# EAGLE schematic FRIDAY_Bridge_SCH3 (EAGLE 9.6.2)
Assembly variants: default

## Sheet 1 of 4
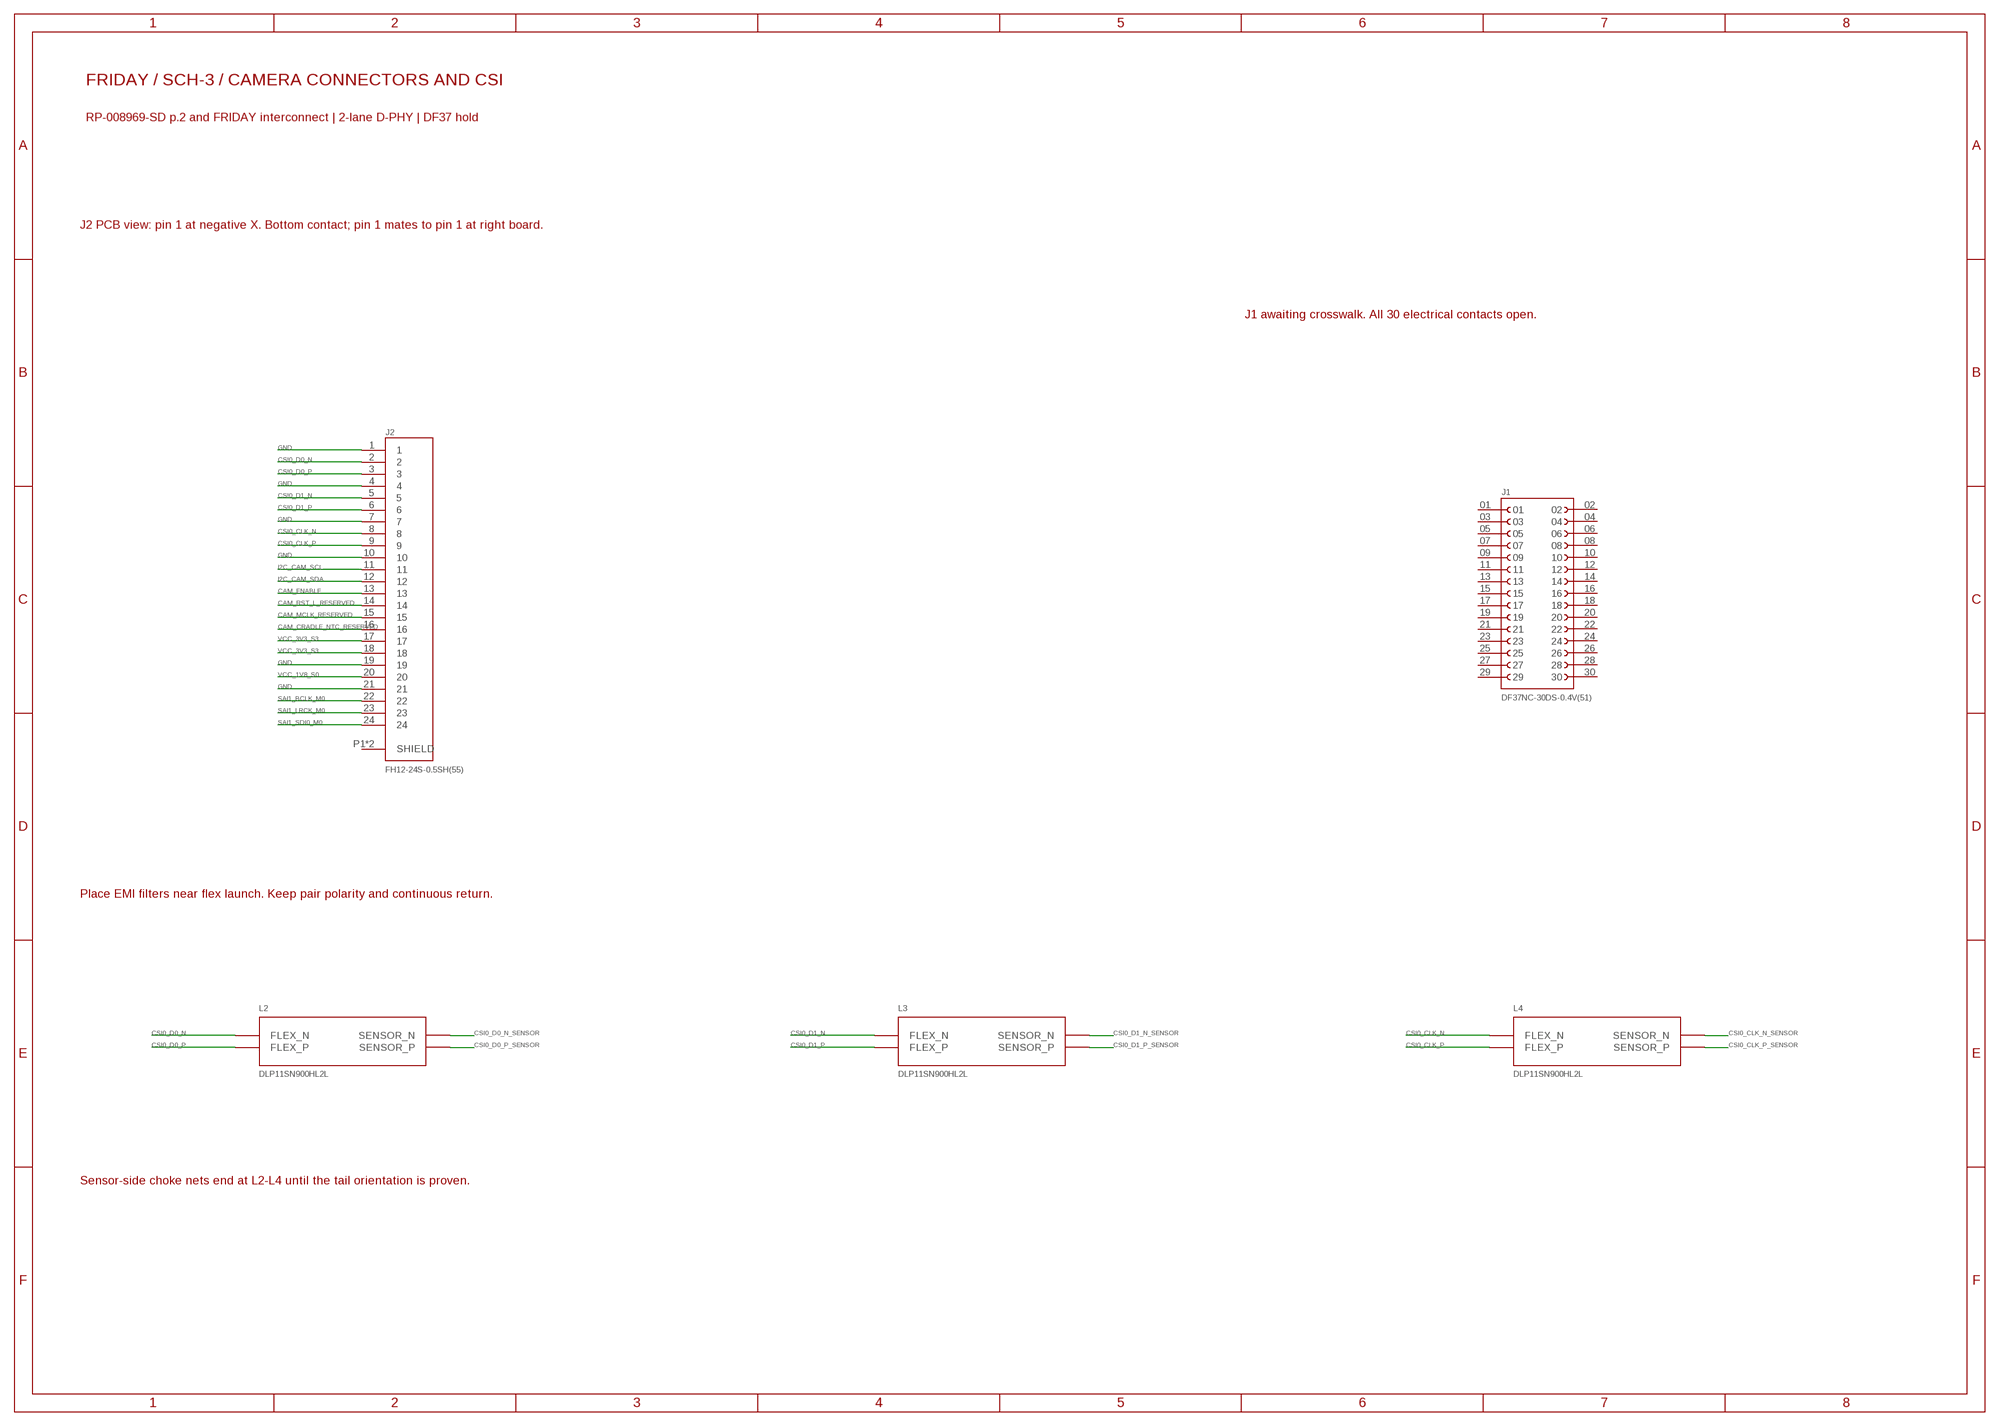
[diagram p0: schematic, sheet 1]

### Parts
J1  DF37NC-30DS-0.4V(51)  [HRS_DF37NC-30DS-0.4V(51)]
J2  FH12-24S-0.5SH(55)  [HRS_FH12-24S-0.5SH(55)]
L2  DLP11SN900HL2L  [DLP11SN_0504]
L3  DLP11SN900HL2L  [DLP11SN_0504]
L4  DLP11SN900HL2L  [DLP11SN_0504]

### Nets
CAM_CRADLE_NTC_RESERVED: J2.16 ; also sheet 3
CAM_ENABLE: J2.13 ; also sheet 2,3
CAM_MCLK_RESERVED: J2.15 ; also sheet 3
CAM_RST_L_RESERVED: J2.14 ; also sheet 3
CSI0_CLK_N: J2.8 L4.1(FLEX_N)
CSI0_CLK_N_SENSOR: L4.2(SENSOR_N)
CSI0_CLK_P: J2.9 L4.4(FLEX_P)
CSI0_CLK_P_SENSOR: L4.3(SENSOR_P)
CSI0_D0_N: J2.2 L2.1(FLEX_N)
CSI0_D0_N_SENSOR: L2.2(SENSOR_N)
CSI0_D0_P: J2.3 L2.4(FLEX_P)
CSI0_D0_P_SENSOR: L2.3(SENSOR_P)
CSI0_D1_N: J2.5 L3.1(FLEX_N)
CSI0_D1_N_SENSOR: L3.2(SENSOR_N)
CSI0_D1_P: J2.6 L3.4(FLEX_P)
CSI0_D1_P_SENSOR: L3.3(SENSOR_P)
GND: J2.1 J2.4 J2.7 J2.10 J2.19 J2.21 ; also sheet 2,3,4
I2C_CAM_SCL: J2.11 ; also sheet 3
I2C_CAM_SDA: J2.12 ; also sheet 3
SAI1_BCLK_M0: J2.22 ; also sheet 4
SAI1_LRCK_M0: J2.23 ; also sheet 4
SAI1_SDI0_M0: J2.24 ; also sheet 4
VCC_1V8_S0: J2.20 ; also sheet 4
VCC_3V3_S3: J2.17 J2.18 ; also sheet 2,3
Unconnected: J1.01 J1.02 J1.03 J1.04 J1.05 J1.06 J1.07 J1.08 J1.09 J1.10 J1.11 J1.12 J1.13 J1.14 J1.15 J1.16 J1.17 J1.18 J1.19 J1.20 J1.21 J1.22 J1.23 J1.24 J1.25 J1.26 J1.27 J1.28 J1.29 J1.30 J2.P1(SHIELD) J2.P2(SHIELD)

### Notes on the sheet
- FRIDAY / SCH-3 / CAMERA CONNECTORS AND CSI
- RP-008969-SD p.2 and FRIDAY interconnect | 2-lane D-PHY | DF37 hold
- J2 PCB view: pin 1 at negative X. Bottom contact; pin 1 mates to pin 1 at right board.
- J1 awaiting crosswalk. All 30 electrical contacts open.
- Place EMI filters near flex launch. Keep pair polarity and continuous return.
- Sensor-side choke nets end at L2-L4 until the tail orientation is proven.

## Sheet 2 of 4
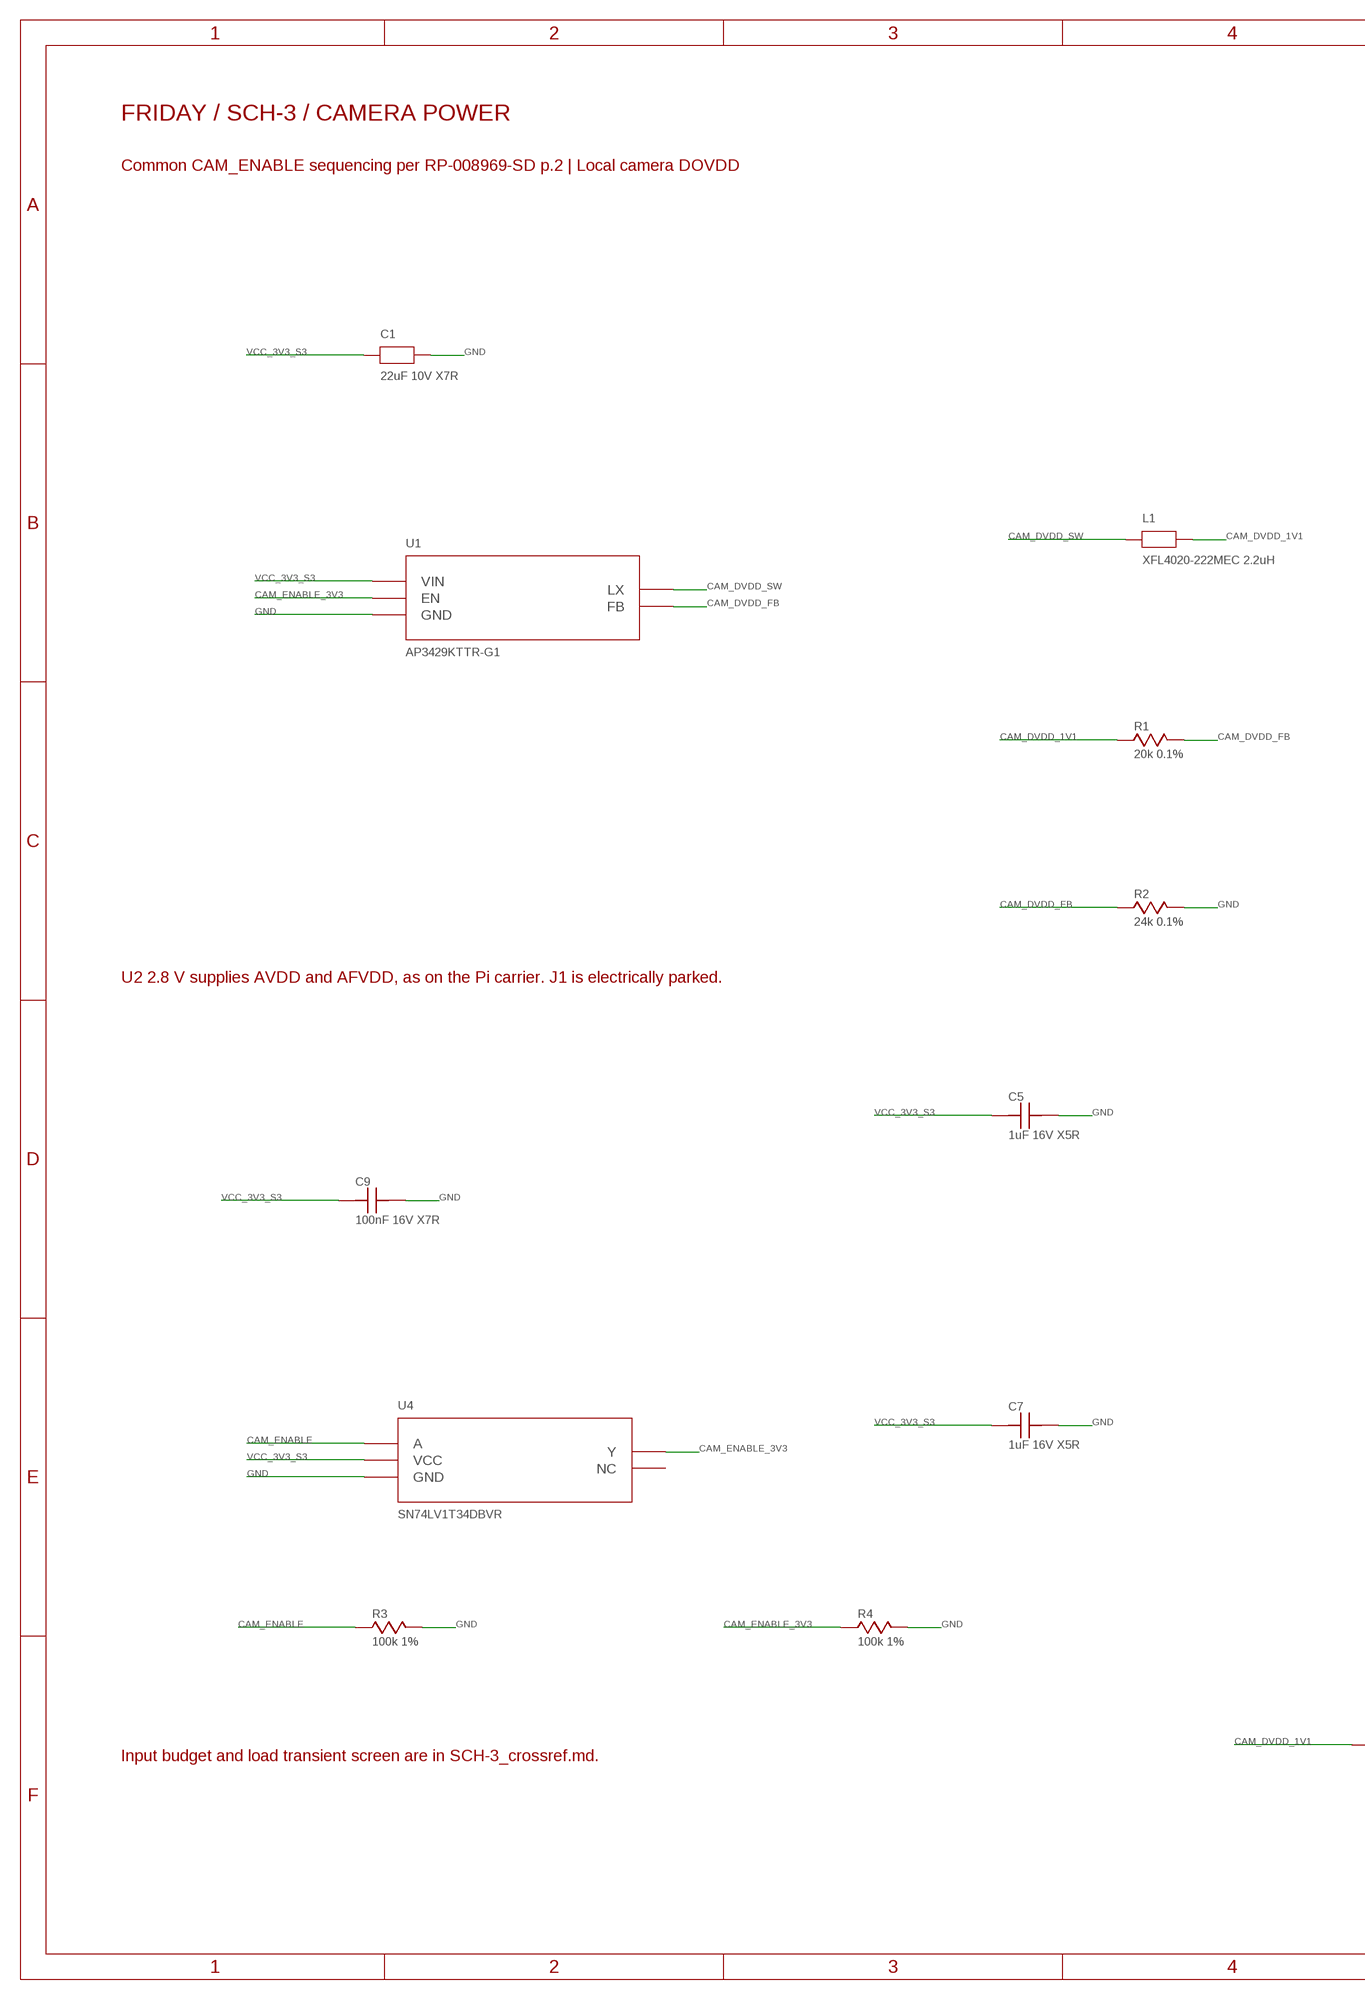
[diagram p1: schematic, sheet 2, part 1 of 2]
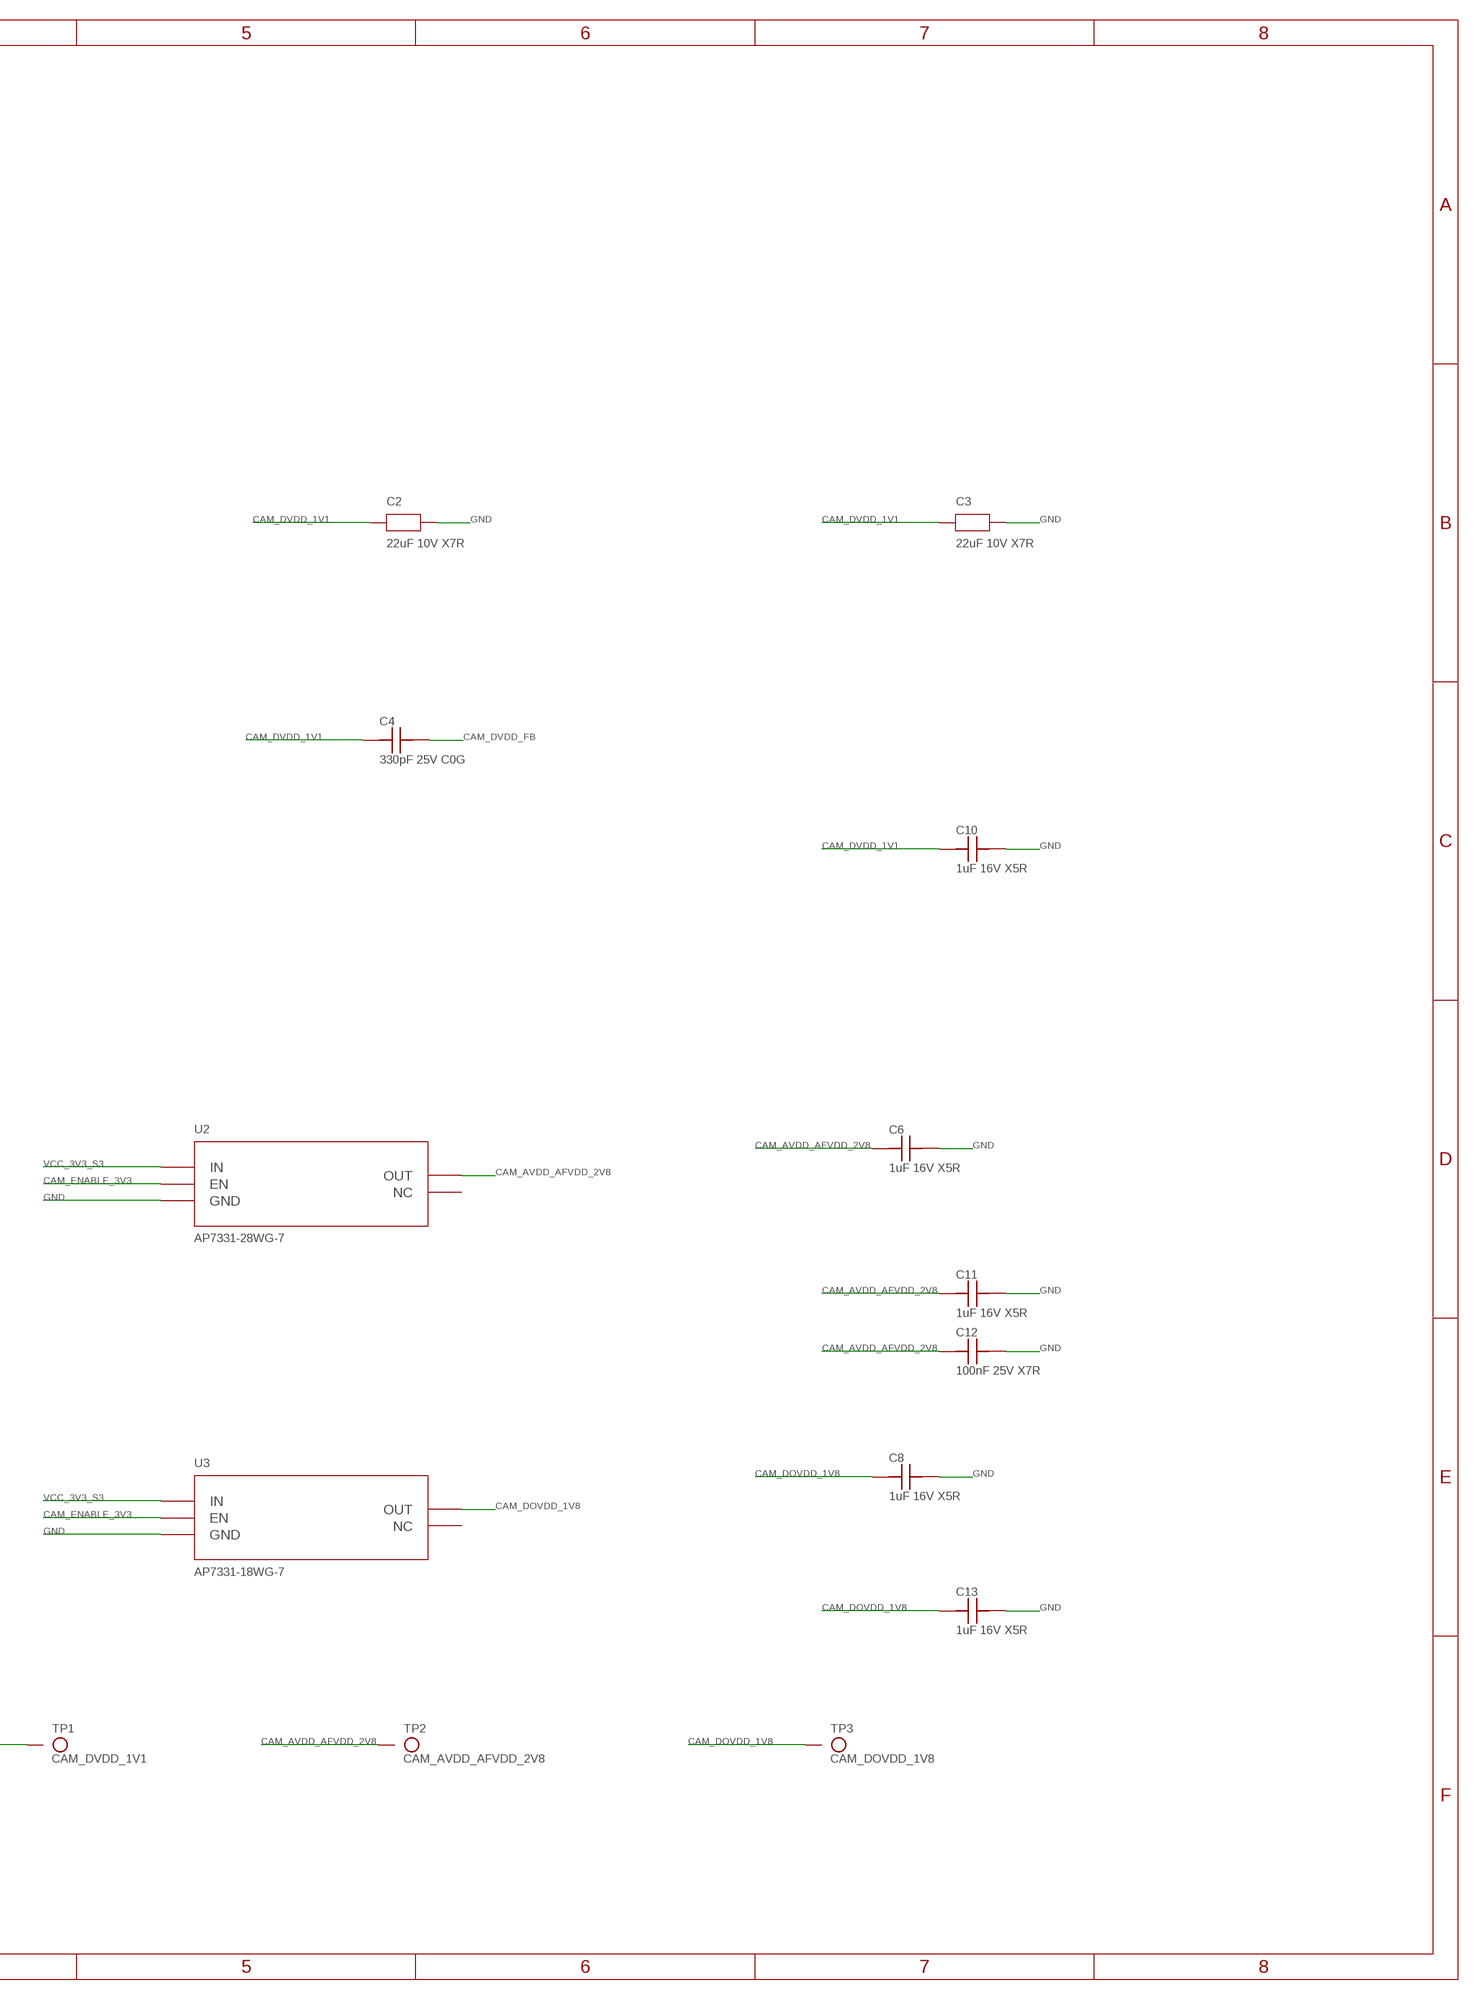
[diagram p2: schematic, sheet 2, part 2 of 2]

### Parts
C1  22uF 10V X7R  C_1206  [MLCC_1206]
C2  22uF 10V X7R  C_1206  [MLCC_1206]
C3  22uF 10V X7R  C_1206  [MLCC_1206]
C4  330pF 25V C0G  C_0402  [C0402]
C5  1uF 16V X5R  C_0402  [C0402]
C6  1uF 16V X5R  C_0402  [C0402]
C7  1uF 16V X5R  C_0402  [C0402]
C8  1uF 16V X5R  C_0402  [C0402]
C9  100nF 16V X7R  C_0402  [C0402]
C10  1uF 16V X5R  C_0402  [C0402]
C11  1uF 16V X5R  C_0402  [C0402]
C12  100nF 25V X7R  C_0402  [C0402]
C13  1uF 16V X5R  C_0402  [C0402]
L1  XFL4020-222MEC 2.2uH  XFL4020  [XFL4020]
R1  20k 0.1%  R_0402  [R0402]
R2  24k 0.1%  R_0402  [R0402]
R3  100k 1%  R_0402  [R0402]
R4  100k 1%  R_0402  [R0402]
TP1  CAM_DVDD_1V1  TP_1MM  [TP_1MM]
TP2  CAM_AVDD_AFVDD_2V8  TP_1MM  [TP_1MM]
TP3  CAM_DOVDD_1V8  TP_1MM  [TP_1MM]
U1  AP3429KTTR-G1  AP3429  [TSOT25_AP3429]
U2  AP7331-28WG-7  AP7331  [SOT25_AP7331]
U3  AP7331-18WG-7  AP7331  [SOT25_AP7331]
U4  SN74LV1T34DBVR  SN74LV1T34  [SOT23_DBV]

### Nets
CAM_AVDD_AFVDD_2V8: C6.1 C11.1 C12.1 TP2.1 U2.5(OUT) ; also sheet 3
CAM_DOVDD_1V8: C8.1 C13.1 TP3.1 U3.5(OUT) ; also sheet 3
CAM_DVDD_1V1: C2.1 C3.1 C4.1 C10.1 L1.2 R1.1 TP1.1 ; also sheet 3
CAM_DVDD_FB: C4.2 R1.2 R2.1 U1.5(FB)
CAM_DVDD_SW: L1.1 U1.3(LX)
CAM_ENABLE: R3.1 U4.2(A) ; also sheet 1,3
CAM_ENABLE_3V3: R4.1 U1.1(EN) U2.3(EN) U3.3(EN) U4.4(Y) ; also sheet 3
GND: C1.2 C2.2 C3.2 C5.2 C6.2 C7.2 C8.2 C9.2 C10.2 C11.2 C12.2 C13.2 R2.2 R3.2 R4.2 U1.2(GND) U2.2(GND) U3.2(GND) U4.3(GND) ; also sheet 1,3,4
VCC_3V3_S3: C1.1 C5.1 C7.1 C9.1 U1.4(VIN) U2.1(IN) U3.1(IN) U4.5(VCC) ; also sheet 1,3
Unconnected: U2.4(NC) U3.4(NC) U4.1(NC)

### Notes on the sheet
- FRIDAY / SCH-3 / CAMERA POWER
- Common CAM_ENABLE sequencing per RP-008969-SD p.2 | Local camera DOVDD
- U2 2.8 V supplies AVDD and AFVDD, as on the Pi carrier. J1 is electrically parked.
- Input budget and load transient screen are in SCH-3_crossref.md.

## Sheet 3 of 4
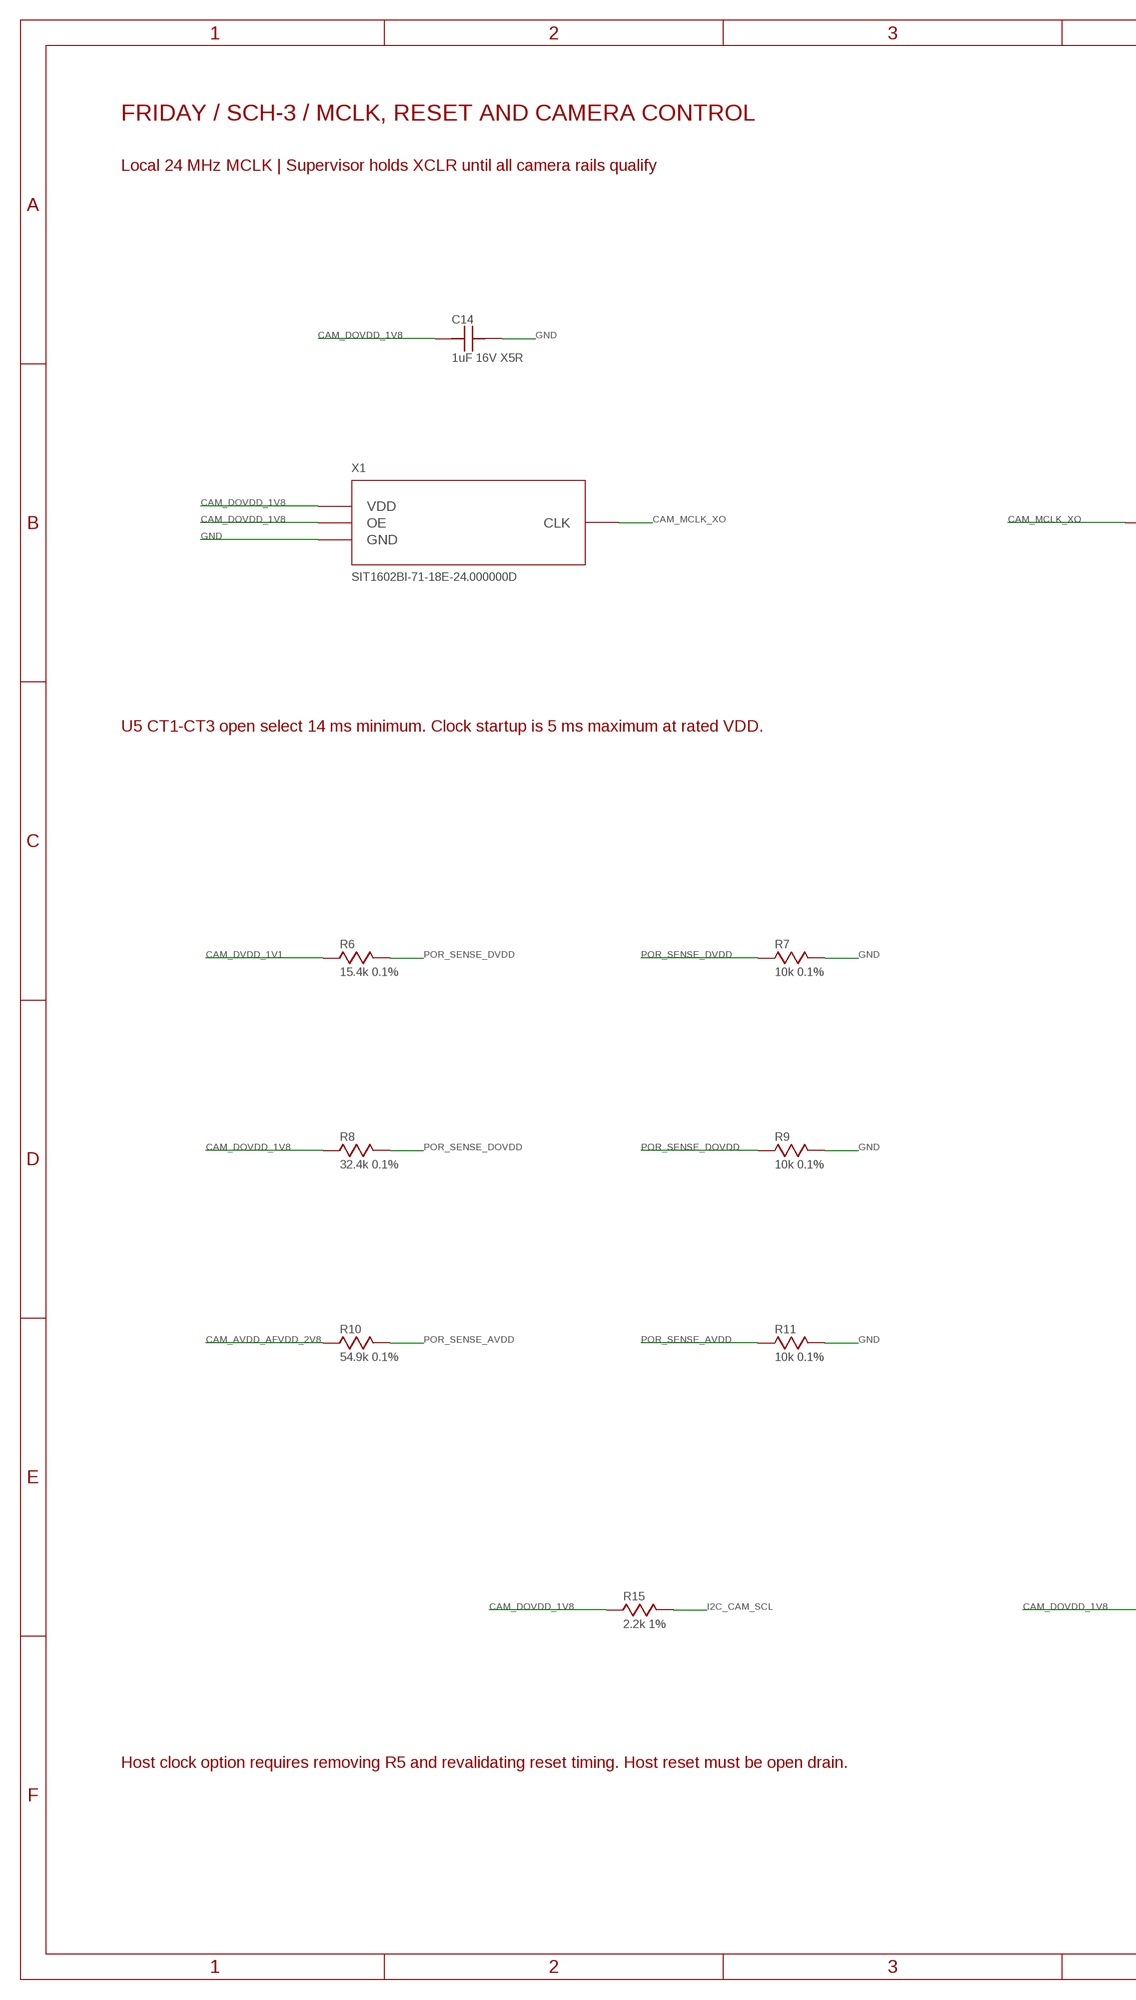
[diagram p3: schematic, sheet 3, part 1 of 2]
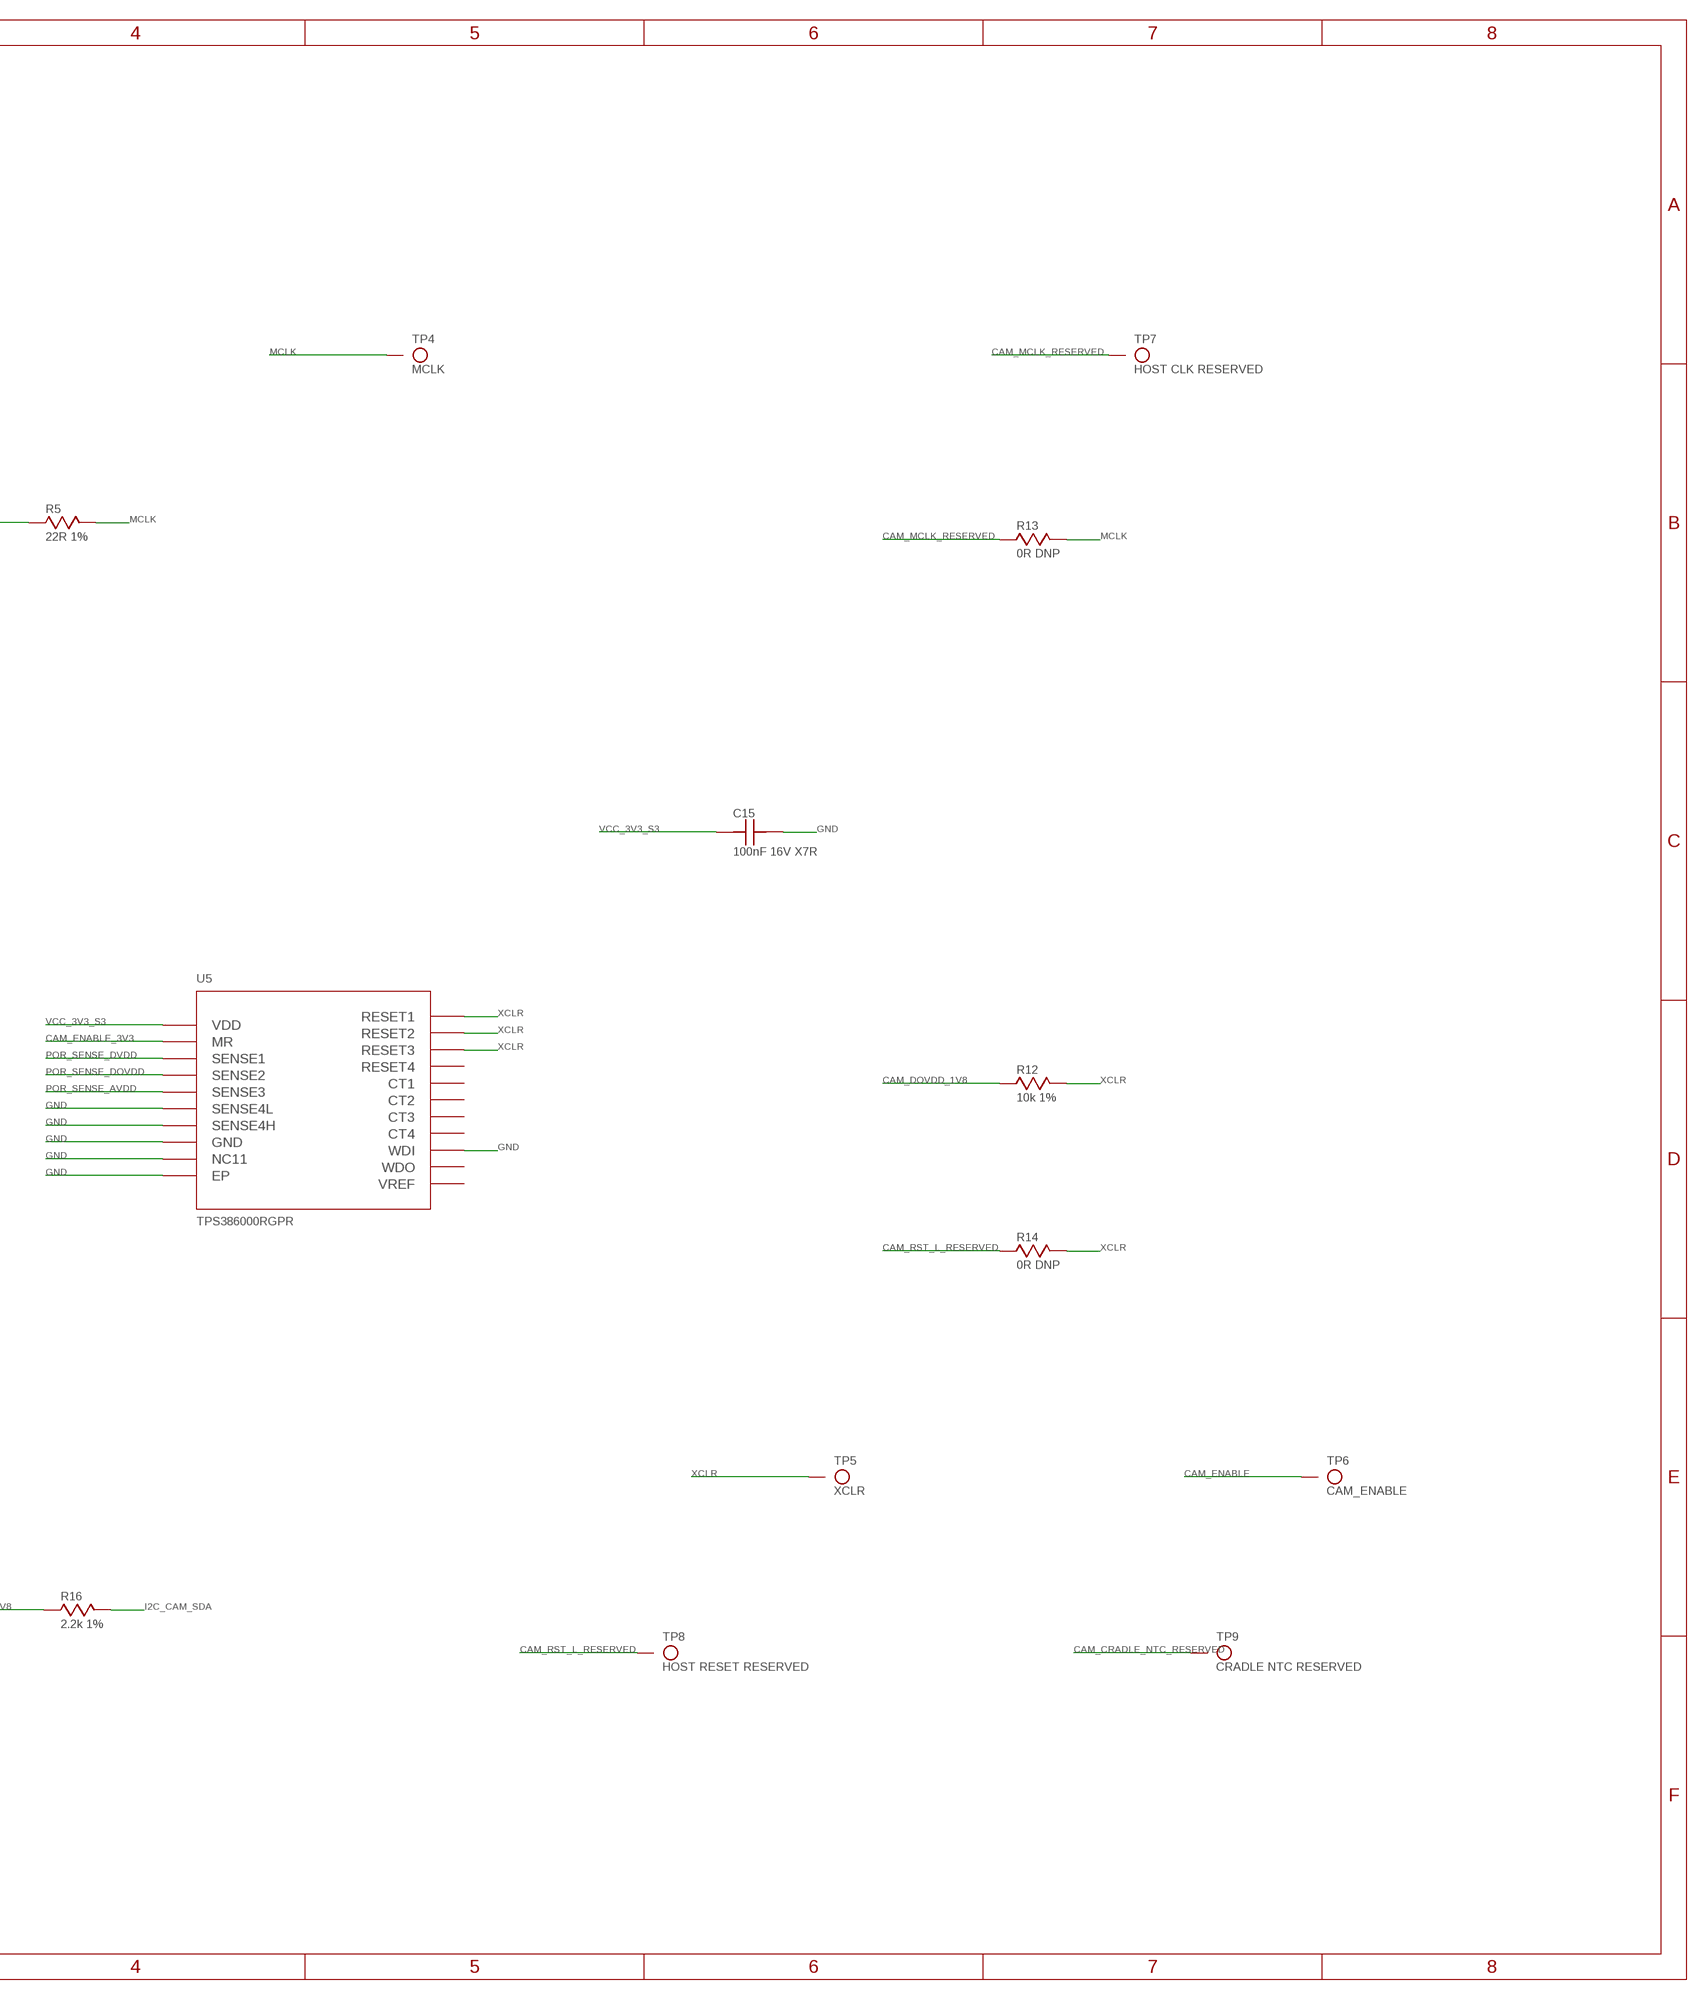
[diagram p4: schematic, sheet 3, part 2 of 2]

### Parts
C14  1uF 16V X5R  C_0402  [C0402]
C15  100nF 16V X7R  C_0402  [C0402]
R5  22R 1%  R_0402  [R0402]
R6  15.4k 0.1%  R_0402  [R0402]
R7  10k 0.1%  R_0402  [R0402]
R8  32.4k 0.1%  R_0402  [R0402]
R9  10k 0.1%  R_0402  [R0402]
R10  54.9k 0.1%  R_0402  [R0402]
R11  10k 0.1%  R_0402  [R0402]
R12  10k 1%  R_0402  [R0402]
R13  0R DNP  R_0402  [R0402]  (not fitted in variant default)
R14  0R DNP  R_0402  [R0402]  (not fitted in variant default)
R15  2.2k 1%  R_0402  [R0402]
R16  2.2k 1%  R_0402  [R0402]
TP4  MCLK  TP_1MM  [TP_1MM]
TP5  XCLR  TP_1MM  [TP_1MM]
TP6  CAM_ENABLE  TP_1MM  [TP_1MM]
TP7  HOST CLK RESERVED  TP_1MM  [TP_1MM]
TP8  HOST RESET RESERVED  TP_1MM  [TP_1MM]
TP9  CRADLE NTC RESERVED  TP_1MM  [TP_1MM]
U5  TPS386000RGPR  TPS386000  [TI_RGP20]
X1  SIT1602BI-71-18E-24.000000D  SIT1602B  [SIT_2016_4]

### Nets
CAM_AVDD_AFVDD_2V8: R10.1 ; also sheet 2
CAM_CRADLE_NTC_RESERVED: TP9.1 ; also sheet 1
CAM_DOVDD_1V8: C14.1 R8.1 R12.1 R15.1 R16.1 X1.1(OE) X1.4(VDD) ; also sheet 2
CAM_DVDD_1V1: R6.1 ; also sheet 2
CAM_ENABLE: TP6.1 ; also sheet 1,2
CAM_ENABLE_3V3: U5.1(MR) ; also sheet 2
CAM_MCLK_RESERVED: R13.1 TP7.1 ; also sheet 1
CAM_MCLK_XO: R5.1 X1.3(CLK)
CAM_RST_L_RESERVED: R14.1 TP8.1 ; also sheet 1
GND: C14.2 C15.2 R7.2 R9.2 R11.2 U5.6(SENSE4H) U5.7(SENSE4L) U5.11(NC11) U5.12(GND) U5.20(WDI) U5.EP X1.2(GND) ; also sheet 1,2,4
I2C_CAM_SCL: R15.2 ; also sheet 1
I2C_CAM_SDA: R16.2 ; also sheet 1
MCLK: R5.2 R13.2 TP4.1
POR_SENSE_AVDD: R10.2 R11.1 U5.8(SENSE3)
POR_SENSE_DOVDD: R8.2 R9.1 U5.9(SENSE2)
POR_SENSE_DVDD: R6.2 R7.1 U5.10(SENSE1)
VCC_3V3_S3: C15.1 U5.14(VDD) ; also sheet 1,2
XCLR: R12.2 R14.2 TP5.1 U5.15(RESET1) U5.16(RESET2) U5.17(RESET3)
Unconnected: U5.2(CT4) U5.3(CT3) U5.4(CT2) U5.5(CT1) U5.13(VREF) U5.18(RESET4) U5.19(WDO)

### Notes on the sheet
- FRIDAY / SCH-3 / MCLK, RESET AND CAMERA CONTROL
- Local 24 MHz MCLK | Supervisor holds XCLR until all camera rails qualify
- U5 CT1-CT3 open select 14 ms minimum. Clock startup is 5 ms maximum at rated VDD.
- Host clock option requires removing R5 and revalidating reset timing. Host reset must be open drain.

## Sheet 4 of 4
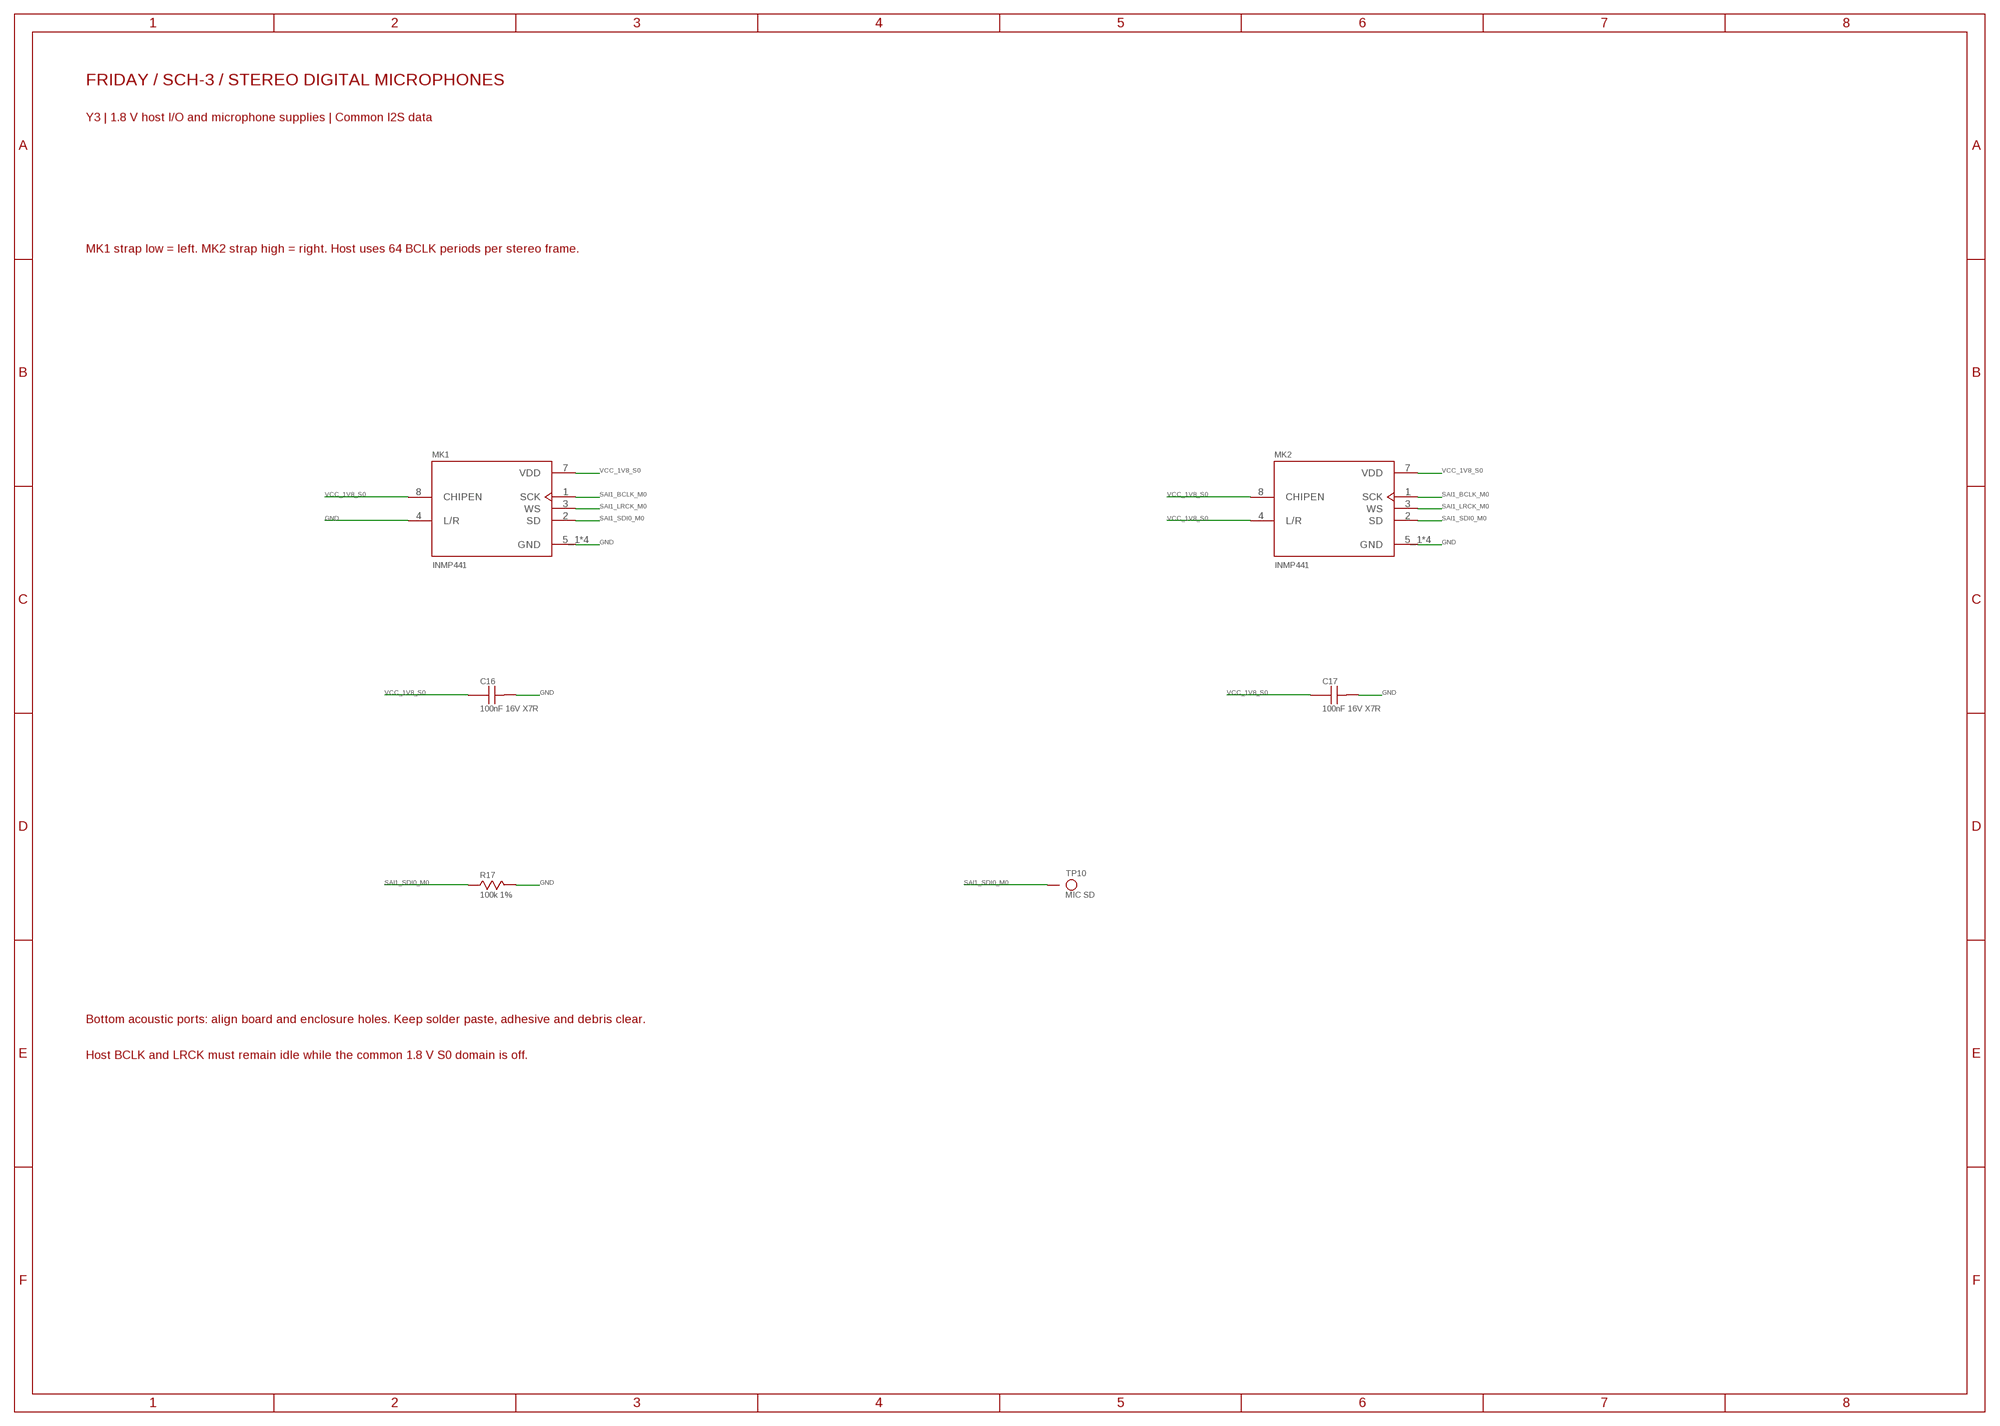
[diagram p5: schematic, sheet 4]

### Parts
C16  100nF 16V X7R  C_0402  [C0402]
C17  100nF 16V X7R  C_0402  [C0402]
MK1  INMP441  [MIC_INMP441]
MK2  INMP441  [MIC_INMP441]
R17  100k 1%  R_0402  [R0402]
TP10  MIC SD  TP_1MM  [TP_1MM]

### Nets
GND: C16.2 C17.2 MK1.4(L/R) MK1.5_1(GND) MK1.5_2(GND) MK1.6(GND) MK1.9(GND) MK2.5_1(GND) MK2.5_2(GND) MK2.6(GND) MK2.9(GND) R17.2 ; also sheet 1,2,3
SAI1_BCLK_M0: MK1.1(SCK) MK2.1(SCK) ; also sheet 1
SAI1_LRCK_M0: MK1.3(WS) MK2.3(WS) ; also sheet 1
SAI1_SDI0_M0: MK1.2(SD) MK2.2(SD) R17.1 TP10.1 ; also sheet 1
VCC_1V8_S0: C16.1 C17.1 MK1.7(VDD) MK1.8(CHIPEN) MK2.4(L/R) MK2.7(VDD) MK2.8(CHIPEN) ; also sheet 1

### Notes on the sheet
- FRIDAY / SCH-3 / STEREO DIGITAL MICROPHONES
- Y3 | 1.8 V host I/O and microphone supplies | Common I2S data
- MK1 strap low = left. MK2 strap high = right. Host uses 64 BCLK periods per stereo frame.
- Bottom acoustic ports: align board and enclosure holes. Keep solder paste, adhesive and debris clear.
- Host BCLK and LRCK must remain idle while the common 1.8 V S0 domain is off.

## Library data of the parts
C1-C3 = FRIDAY_SCH3_Camera:C_1206
C4-C17 = FRIDAY_SCH1_Support:C_0402
J1 = DF37NC-30DS-0.4V_51_:DF37NC-30DS-0.4V(51); DATASHEET_URL: https://s3.amazonaws.com/snapeda/datasheet/DF37NC-30DS-04V-51-_Hirose.pdf; DESCRIPTION: 30 Position Connector Receptacle, Center Strip Contacts Surface Mount Gold; MANUFACTURER: Hirose; MAXIMUM_PACKAGE_HEIGHT: 1.08mm; MPN: DF37NC-30DS-0.4V(51); PARTREV: 11.02.09; SOURCE_URL: https://www.snapeda.com/parts/DF37NC-30DS-0.4V(51)/Hirose/view-part/; STANDARD: Manufacturer Recommendations
J2 = FH12-24S-0.5SH_55_:FH12-24S-0.5SH(55); DATASHEET_URL: https://s3.amazonaws.com/snapeda/datasheet/FH12-24S-05SH-55-_Hirose.pdf; DESCRIPTION: 24 Position FFC, FPC Connector Contacts, Bottom 0.020" (0.50mm) Surface Mount, Right Angle; MANUFACTURER: Hirose; MAXIMUM_PACKAGE_HEIGHT: 2.2mm; MPN: FH12-24S-0.5SH(55); SOURCE_URL: https://www.snapeda.com/parts/FH12-24S-0.5SH(55)/Hirose+Electric+Co+Ltd/view-part/; STANDARD: Manufacturer recommendations
L1 = FRIDAY_SCH3_Camera:XFL4020
L2-L4 = FRIDAY_SCH3_Camera:DLP11SN900HL2L
MK1 MK2 = INMP441:INMP441; DATASHEET_URL: https://s3.amazonaws.com/snapeda/datasheet/INMP441_TDK_InvenSense.pdf; DESCRIPTION: EVAL BOARD MEMS MIC INMP441; MANUFACTURER: TDK InvenSense; MAXIMUM_PACKAGE_HEIGHT: 1.05 mm; MPN: INMP441; PARTREV: 1.1; SOURCE_URL: https://www.snapeda.com/parts/INMP441/TDK/view-part/; STANDARD: Manufacturer Recommendations
R1-R17 = FRIDAY_SCH1_Support:R_0402
TP1-TP10 = FRIDAY_SCH1_Support:TP_1MM
U1 = FRIDAY_SCH3_Camera:AP3429
U2 U3 = FRIDAY_SCH3_Camera:AP7331
U4 = FRIDAY_SCH3_Camera:SN74LV1T34
U5 = FRIDAY_SCH3_Camera:TPS386000
X1 = FRIDAY_SCH3_Camera:SIT1602B